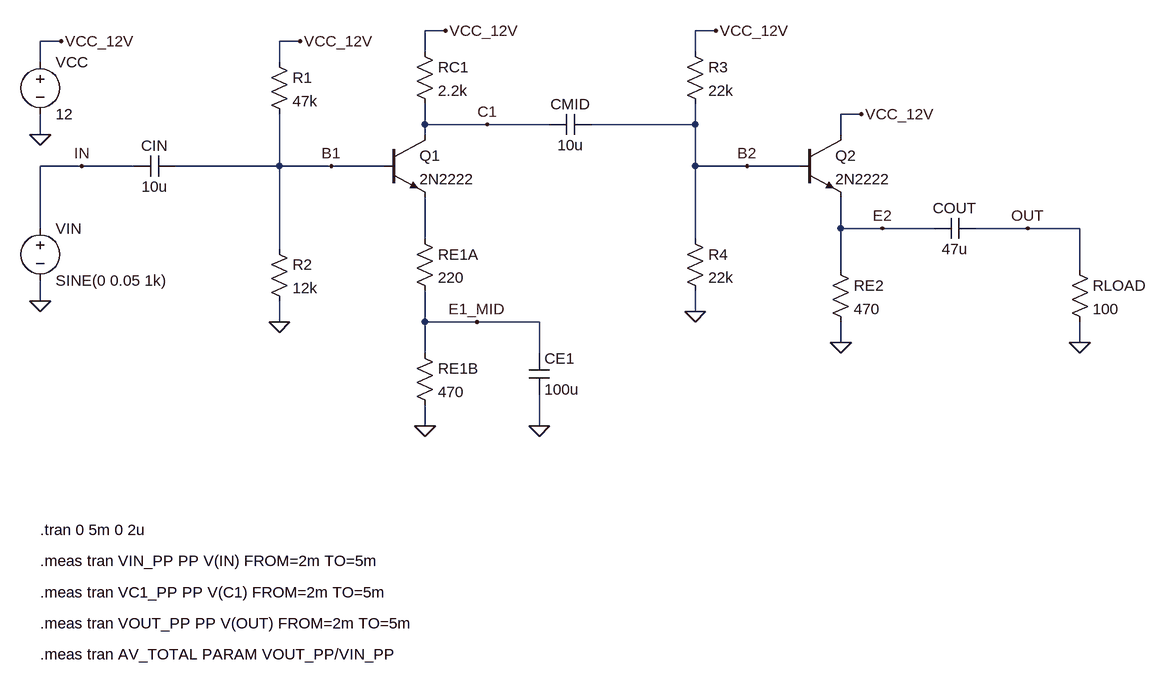
[diagram p0: schematic demo2_cascaded_amp.asc]
demo2_cascaded_amp.asc, the LTspice schematic file:
Version 4
SHEET 1 1968 1152
WIRE 64 96 64 64
WIRE 64 64 96 64
WIRE 64 176 64 208
WIRE 64 432 64 464
WIRE 64 352 64 256
WIRE 64 256 208 256
WIRE 432 96 432 64
WIRE 432 64 464 64
WIRE 432 176 432 384
WIRE 432 464 432 496
WIRE 272 256 432 256
WIRE 432 256 592 256
WIRE 656 80 656 48
WIRE 656 48 688 48
WIRE 656 160 656 208
WIRE 656 304 656 368
WIRE 656 448 656 544
WIRE 656 624 656 656
WIRE 656 496 832 496
WIRE 832 496 832 544
WIRE 832 608 832 656
WIRE 656 192 848 192
WIRE 1072 80 1072 48
WIRE 1072 48 1104 48
WIRE 1072 160 1072 368
WIRE 1072 448 1072 480
WIRE 912 192 1072 192
WIRE 1072 256 1232 256
WIRE 1296 208 1296 176
WIRE 1296 176 1328 176
WIRE 1296 304 1296 416
WIRE 1296 496 1296 528
WIRE 1296 352 1440 352
WIRE 1504 352 1664 352
WIRE 1664 352 1664 416
WIRE 1664 496 1664 528
FLAG 96 64 VCC_12V
FLAG 64 208 0
FLAG 64 464 0
FLAG 128 256 IN
FLAG 464 64 VCC_12V
FLAG 432 496 0
FLAG 512 256 B1
FLAG 688 48 VCC_12V
FLAG 656 656 0
FLAG 736 496 E1_MID
FLAG 832 656 0
FLAG 752 192 C1
FLAG 1104 48 VCC_12V
FLAG 1072 480 0
FLAG 1152 256 B2
FLAG 1328 176 VCC_12V
FLAG 1296 528 0
FLAG 1360 352 E2
FLAG 1584 352 OUT
FLAG 1664 528 0
SYMBOL voltage 64 80 R0
WINDOW 3 24 96 Left 2
SYMATTR InstName VCC
SYMATTR Value 12
SYMBOL voltage 64 336 R0
WINDOW 3 24 96 Left 2
SYMATTR InstName VIN
SYMATTR Value SINE(0 0.05 1k)
SYMBOL cap 272 240 R90
WINDOW 0 0 32 VBottom 2
WINDOW 3 32 32 VTop 2
SYMATTR InstName CIN
SYMATTR Value 10u
SYMBOL res 416 80 R0
SYMATTR InstName R1
SYMATTR Value 47k
SYMBOL res 416 368 R0
SYMATTR InstName R2
SYMATTR Value 12k
SYMBOL npn 592 208 R0
SYMATTR InstName Q1
SYMATTR Value 2N2222
SYMBOL res 640 64 R0
SYMATTR InstName RC1
SYMATTR Value 2.2k
SYMBOL res 640 352 R0
SYMATTR InstName RE1A
SYMATTR Value 220
SYMBOL res 640 528 R0
SYMATTR InstName RE1B
SYMATTR Value 470
SYMBOL cap 816 544 R0
SYMATTR InstName CE1
SYMATTR Value 100u
SYMBOL cap 912 176 R90
WINDOW 0 0 32 VBottom 2
WINDOW 3 32 32 VTop 2
SYMATTR InstName CMID
SYMATTR Value 10u
SYMBOL res 1056 64 R0
SYMATTR InstName R3
SYMATTR Value 22k
SYMBOL res 1056 352 R0
SYMATTR InstName R4
SYMATTR Value 22k
SYMBOL npn 1232 208 R0
SYMATTR InstName Q2
SYMATTR Value 2N2222
SYMBOL res 1280 400 R0
SYMATTR InstName RE2
SYMATTR Value 470
SYMBOL cap 1504 336 R90
WINDOW 0 0 32 VBottom 2
WINDOW 3 32 32 VTop 2
SYMATTR InstName COUT
SYMATTR Value 47u
SYMBOL res 1648 400 R0
SYMATTR InstName RLOAD
SYMATTR Value 100
TEXT 64 816 Left 2 !.tran 0 5m 0 2u
TEXT 64 864 Left 2 !.meas tran VIN_PP PP V(IN) FROM=2m TO=5m
TEXT 64 912 Left 2 !.meas tran VC1_PP PP V(C1) FROM=2m TO=5m
TEXT 64 960 Left 2 !.meas tran VOUT_PP PP V(OUT) FROM=2m TO=5m
TEXT 64 1008 Left 2 !.meas tran AV_TOTAL PARAM VOUT_PP/VIN_PP

The netlist it stands for:
* demo2_cascaded_amp.asc
VCC VCC_12V 0 12
VIN IN 0 SINE(0 0.05 1k)
CIN B1 IN 10u
R1 VCC_12V B1 47k
R2 B1 0 12k
Q1 C1 B1 N001 0 2N2222
RC1 VCC_12V C1 2.2k
RE1A N001 E1_MID 220
RE1B E1_MID 0 470
CE1 E1_MID 0 100u
CMID B2 C1 10u
R3 VCC_12V B2 22k
R4 B2 0 22k
Q2 VCC_12V B2 E2 0 2N2222
RE2 E2 0 470
COUT OUT E2 47u
RLOAD OUT 0 100
.model NPN NPN
.model PNP PNP
.lib standard.bjt
.tran 0 5m 0 2u
.meas tran VIN_PP PP V(IN) FROM=2m TO=5m
.meas tran VC1_PP PP V(C1) FROM=2m TO=5m
.meas tran VOUT_PP PP V(OUT) FROM=2m TO=5m
.meas tran AV_TOTAL PARAM VOUT_PP/VIN_PP
.backanno
.end